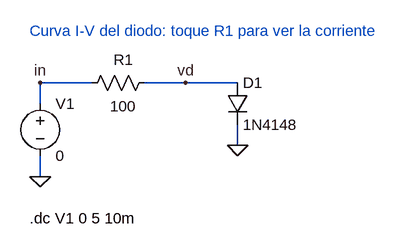
[diagram p0: schematic Curva del diodo.asc]
Curva del diodo.asc, the LTspice schematic file:
Version 4
SHEET 1 880 680
WIRE 80 0 0 0
WIRE 304 0 160 0
WIRE 0 32 0 0
WIRE 304 96 304 64
WIRE 0 144 0 112
FLAG 0 144 0
FLAG 304 96 0
FLAG 0 0 in
FLAG 224 0 vd
SYMBOL voltage 0 16 R0
SYMATTR InstName V1
SYMATTR Value 0
SYMBOL res 64 16 R270
WINDOW 0 36 64 VTop 2
WINDOW 3 -4 64 VBottom 2
SYMATTR InstName R1
SYMATTR Value 100
SYMBOL diode 288 0 R0
SYMATTR InstName D1
SYMATTR Value 1N4148
TEXT -16 208 Left 2 !.dc V1 0 5 10m
TEXT -16 -80 Left 2 ;Curva I-V del diodo: toque R1 para ver la corriente

The netlist it stands for:
* Curva del diodo.asc
V1 in 0 0
R1 in vd 100
D1 vd 0 1N4148
.model D D
.lib standard.dio
.dc V1 0 5 10m
* Curva I-V del diodo: toque R1 para ver la corriente
.backanno
.end